# EAGLE design schematics-v5.1 (EAGLE 9.6.2)
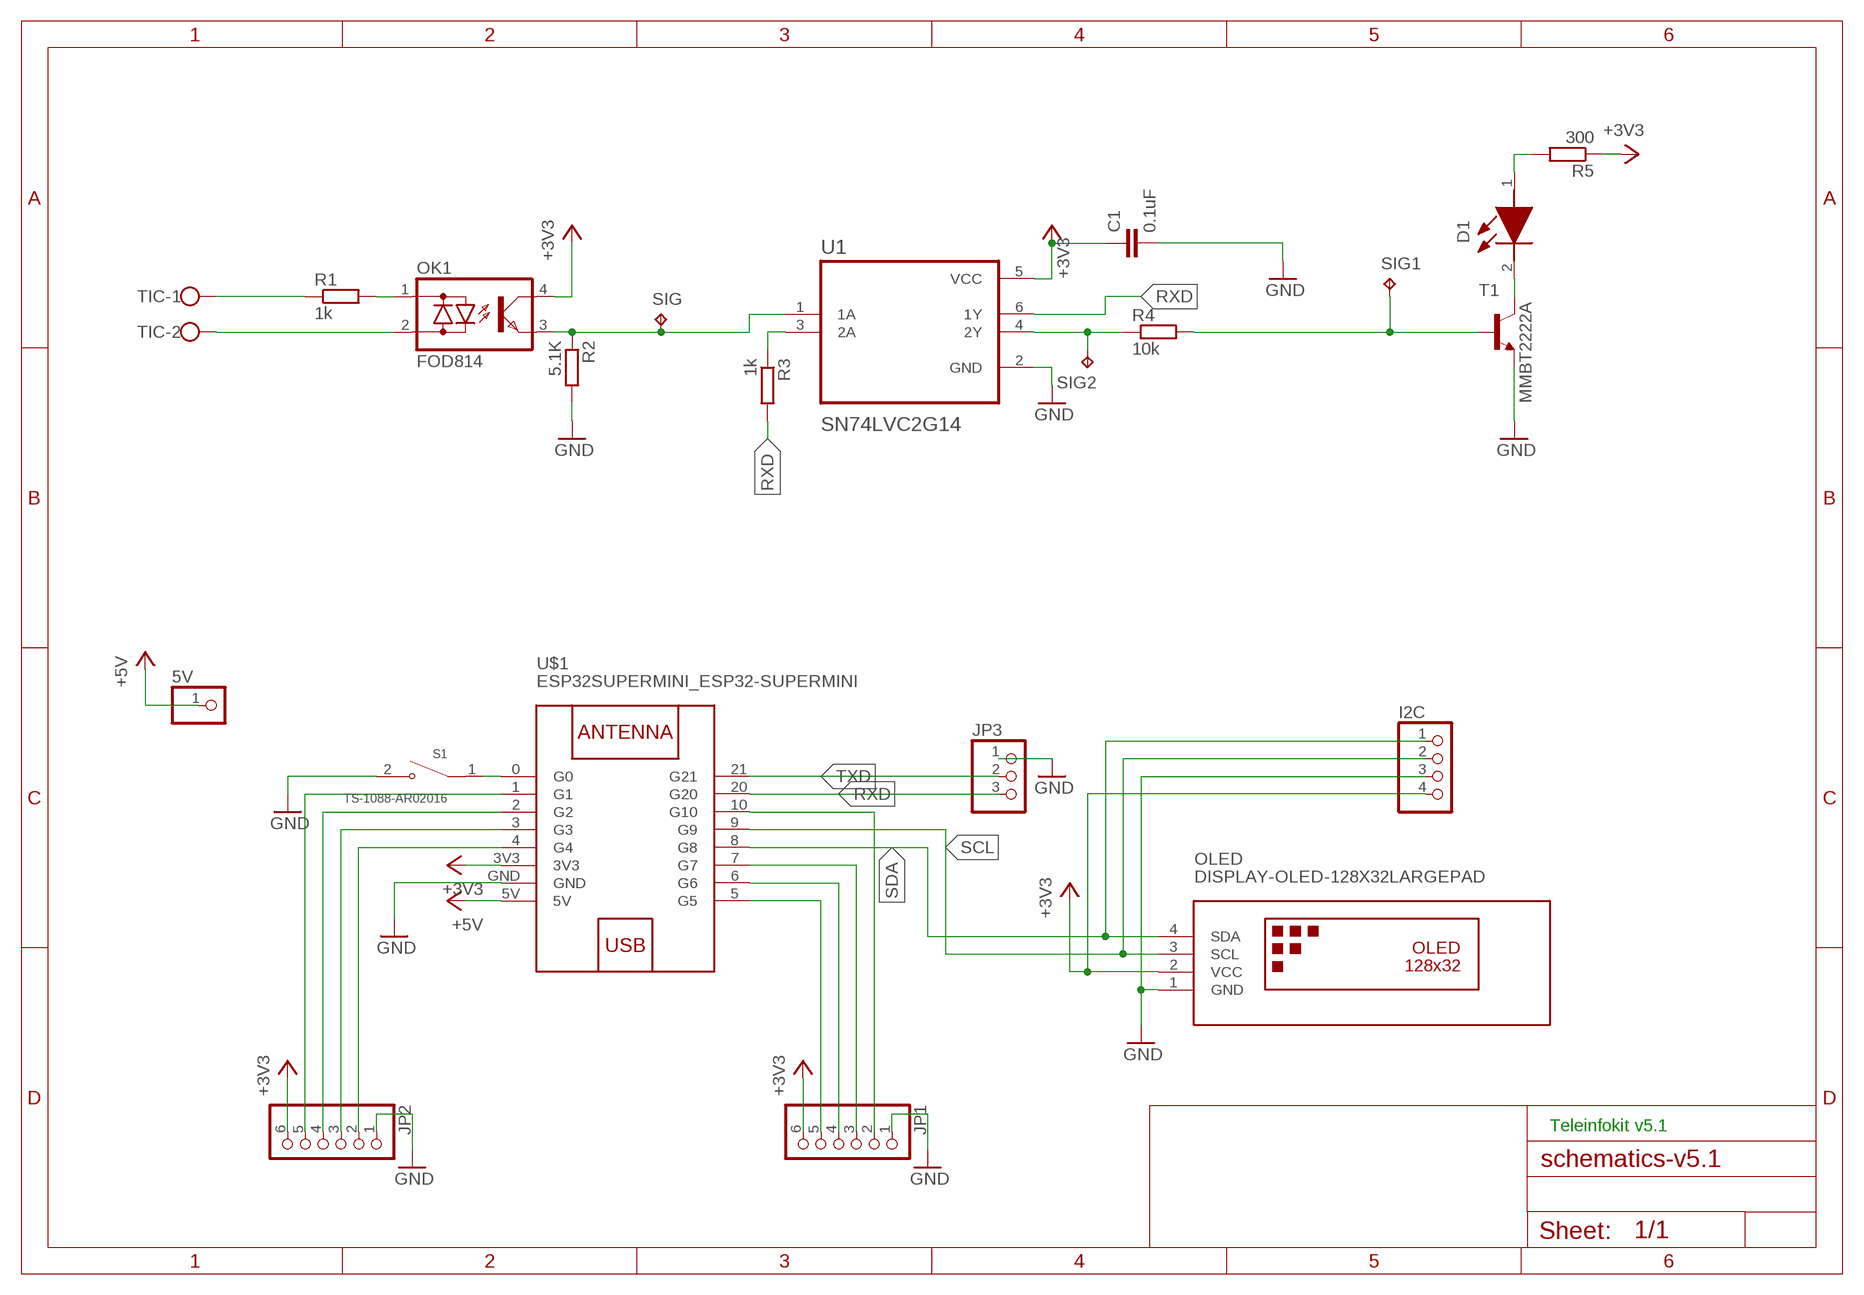
[diagram p0: schematic, sheet 1]

## Parts
5V  PINHD-1X1  [1X01]
C1  0.1uF  C-EUC0402K  [C0402K]
D1  17-21SURC_S530-A2_TR8  [1721SURCS530A2TR8]
I2C  PINHD-1X4ROUNDLARGE  [1X04ROUNDLARGE]
JP1  PINHD-1X6CB  [1X06-CLEANBIG]
JP2  PINHD-1X6CB  [1X06-CLEANBIG]
JP3  PINHD-1X3  [1X03]
OK1  FOD814  SFH6206  [DIL4-SMD]
OLED  DISPLAY-OLED-128X32LARGEPAD  [DISPLAY-OLED-128X32LARGE]
R1  1k  R-EU_R0805  [R0805]
R2  5.1K  R-EU_R0603  [R0603]
R3  1k  R-EU_R0805  [R0805]
R4  10k  R-EU_R0805  [R0805]
R5  300  R-EU_R0805  [R0805]
S1  TS-1088-AR02016  [SW_TS-1088-AR02016]
SIG  TPB1,27  [B1,27]
SIG1  TPB1,27  [B1,27]
SIG2  TPB1,27  [B1,27]
T1  MMBT2222A  MMBT2222ALT1-NPN-SOT23-BEC  [SOT23-BEC]
TIC  W237-102  [W237-102]
U1  SN74LVC2G14  SN74LVC2G14DBVR  [SOT95P280X145-6N]
U$1  ESP32SUPERMINI_ESP32-SUPERMINI  [ESP32SUPERMINI_ESP32-SUPERMINI]

## Nets
+3V3: C1.1 I2C.4 JP1.6 JP2.6 OK1.4(C) OLED.2(VCC) R5.1 U1.5(VCC) U$1.3V3
+5V: 5V.1 U$1.5V
GND: C1.2 I2C.3 JP1.1 JP2.1 JP3.1 OLED.1(GND) R2.2 S1.2 T1.E U1.2(GND) U$1.GND
IO1: JP2.5 U$1.1(G1)
IO2: JP2.4 U$1.2(G2)
IO3: JP2.3 U$1.3(G3)
IO4: JP2.2 U$1.4(G4)
IO5: JP1.5 U$1.5(G5)
IO6: JP1.4 U$1.6(G6)
IO7: JP1.3 U$1.7(G7)
IO10: JP1.2 U$1.10(G10)
N$1: OK1.1(AC1) R1.2
N$3: D1.1(A) R5.2
N$5: R4.1 SIG2.TP U1.4(2Y)
N$7: R1.1 TIC.1
N$8: OK1.2(AC2) TIC.2
N$11: OK1.3(E) R2.1 SIG.TP U1.1(1A)
N$12: D1.2(K) T1.C
N$13: R4.2 SIG1.TP T1.B
N$15: R3.1 U1.3(2A)
N$25: S1.1 U$1.0(G0)
RXD: JP3.3 R3.2 U1.6(1Y) U$1.20(G20)
SCL: I2C.2 OLED.3(SCL) U$1.9(G9)
SDA: I2C.1 OLED.4(SDA) U$1.8(G8)
TXD: JP3.2 U$1.21(G21)

## Notes on the sheet
- Teleinfokit v5.1

## Library data of the parts
5V = adafruit:PINHD-1X1: Pin header 1x1 for 0.1" spacing With round pins
C1 = rcl:C-EU: CAPACITOR, European symbol; LCSC_PART: C1525; SPICEPREFIX: C
D1 = 17-21SURC_S530-A2_TR8:17-21SURC_S530-A2_TR8: Standard LEDs - SMD 1.1mm Height Source: Datasheet <https://media.digikey.com/pdf/Data Sheets/Everlight PDFs/17-21SURC-S530-A2-TR8-V5~.pdf>; ARROW_PART_NUMBER: 17-21SURC/S530-A2/TR8; ARROW_PRICE-STOCK: https://www.arrow.com/en/products/17-21surcs530-a2tr8/everlight-electronics; DESCRIPTION: Standard LEDs - SMD 1.1mm Height; HEIGHT: mm; MANUFACTURER_NAME: Everlight; MANUFACTURER_PART_NUMBER: 17-21SURC/S530-A2/TR8; MOUSER_PART_NUMBER: N/A; MOUSER_PRICE-STOCK: https://www.mouser.co.uk/ProductDetail/Everlight/17-21SURC-S530-A2-TR8?qs=8cKuZ6Ok2lY9160apvjjyQ%3D%3D
I2C = pinhead-edit:PINHD-1X4: PIN HEADER
JP1 JP2 = adafruit:PINHD-1X6: PIN HEADER
JP3 = adafruit:PINHD-1X3: PIN HEADER
OK1 = optocoupler:SFH620: Optocoupler, Phototransistor Output, AC Input Source: http://www.vishay.com/docs/83675/sfh620.pdf; LCSC_PART: C479718; MF: VISHAY/TELEFUNKEN; MPN: SFH6206-3; OC_FARNELL: 1469585; OC_NEWARK: 58K2214
OLED = oled-edit:DISPLAY-OLED-128X32: 128x32 Dot Matrix OLED Module with I2C interface based on SSD1306 chip More details available here: http://www.tinyosshop.com/index.php?route=product/product&product_id=953 Schematic available here: http://www.tinyosshop.com/datasheet/OLED%2012832.pdf SSD1306 datasheet: https://cdn-shop.adafruit.com/datasheets/SSD1306.pdf Click here to find device on ebay.com <http://www.ebay.com/sch/oled+display+128x32+i2c>; LCSC_PART: C2718488
R1 = rcl:R-EU_: RESISTOR, European symbol; LCSC_PART: C17513; SPICEPREFIX: R
R2 = rcl:R-EU_: RESISTOR, European symbol; LCSC_PART: C23186; SPICEPREFIX: R
R3 R4 = rcl:R-EU_: RESISTOR, European symbol; LCSC_PART: C17414; SPICEPREFIX: R
R5 = rcl:R-EU_: RESISTOR, European symbol; LCSC_PART: C17617; SPICEPREFIX: R
S1 = TS-1088-AR02016:TS-1088-AR02016: Check availability <https://pricing.snapeda.com/parts/TS-1088-AR02016/Xunpu/view-part?ref=eda>; AVAILABILITY: Not in stock; CHECK_PRICES: https://www.snapeda.com/parts/TS-1088-AR02016/Xunpu/view-part/?ref=eda; DESCRIPTION: 50mA 4mm 100MΩ 100,000 Times 12V 160gf 3mm 2mm Round Button Vertical welding SPST SMD Tactile Switches ROHS; LCSC_PART: C720477; MF: Xunpu; MP: TS-1088-AR02016; PACKAGE: Package; PRICE: None; SNAPEDA_LINK: https://www.snapeda.com/parts/TS-1088-AR02016/Xunpu/view-part/?ref=snap
SIG SIG1 SIG2 = testpad:TP: Test pad
T1 = transistor:*-NPN-: NPN Transistror BF959 corrected 2008.03.06; LCSC_PART: C8512
TIC = conn-teleinfokit:W237-102: WAGO SCREW CLAMP; MPN: 237-102; OC_FARNELL: unknown; OC_NEWARK: 70K9898
U1 = SN74LVC2G14DBVR:SN74LVC2G14DBVR: Check availability <https://pricing.snapeda.com/parts/SN74LVC2G14DBVR/Texas%20Instruments/view-part?ref=eda>; AVAILABILITY: In Stock; DESCRIPTION: 2-ch, 1.65-V to 5.5-V inverters with Schmitt-Trigger inputs; LCSC_PART: C12401; MF: Texas Instruments; MP: SN74LVC2G14DBVR; PACKAGE: SOT-23-6 Texas Instruments; PRICE: None; PURCHASE-URL: https://pricing.snapeda.com/search/part/SN74LVC2G14DBVR/?ref=eda
U$1 = ESP32C3supermini:ESP32SUPERMINI_ESP32-SUPERMINI: WEMOS D1 mini: Mini Wi-Fi Board based on ESP-8266 device More details can be found here: https://www.wemos.cc/product/d1-mini.html Click here to find device on ebay.com <http://www.ebay.com/sch/wemos+d1+mini+nodemcu>

## Board
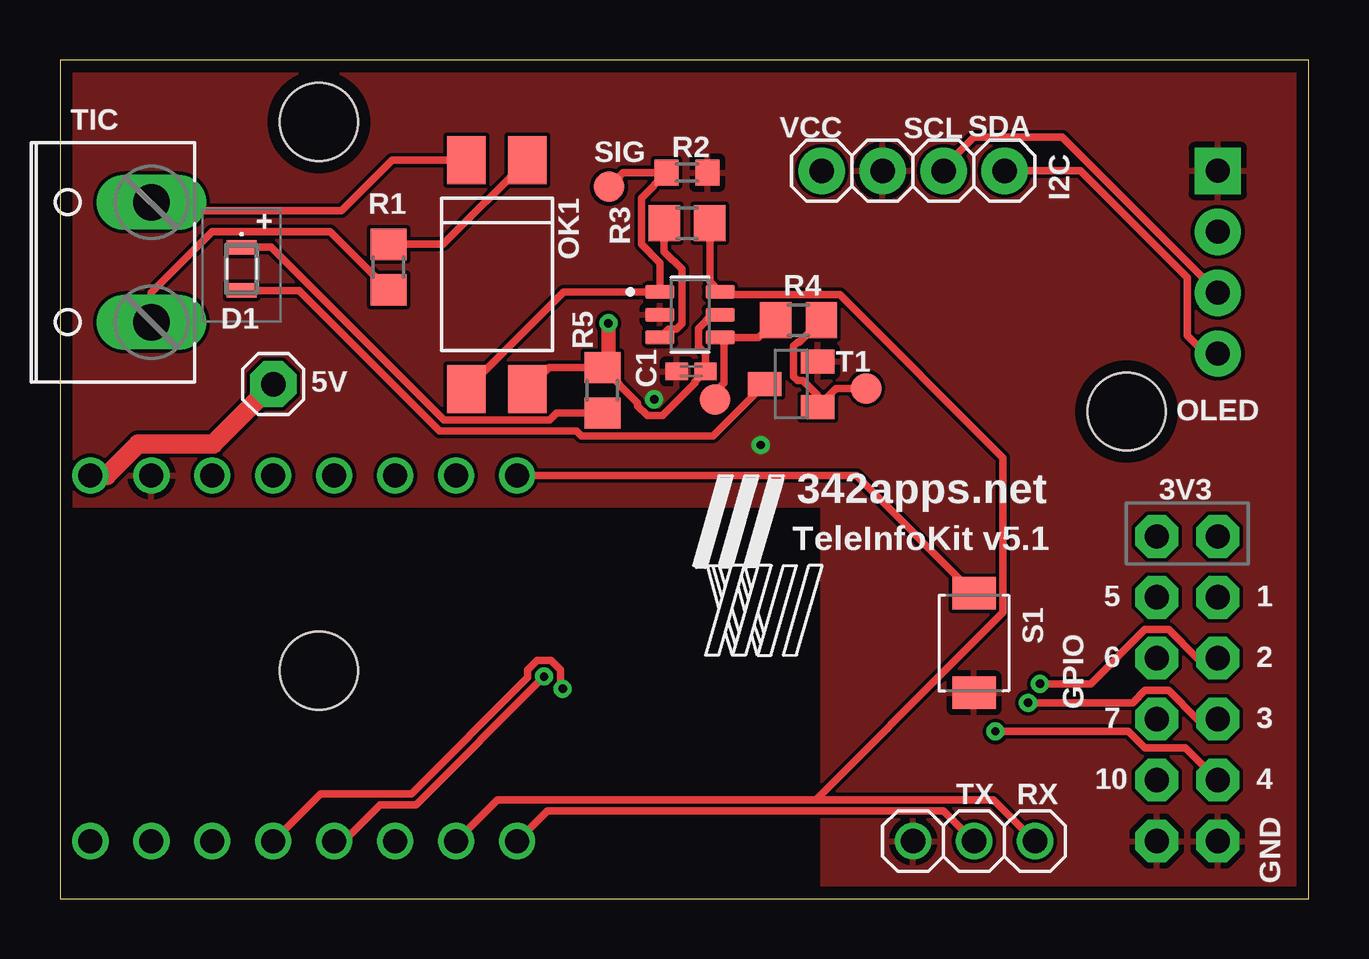
[diagram p1: board, top side]
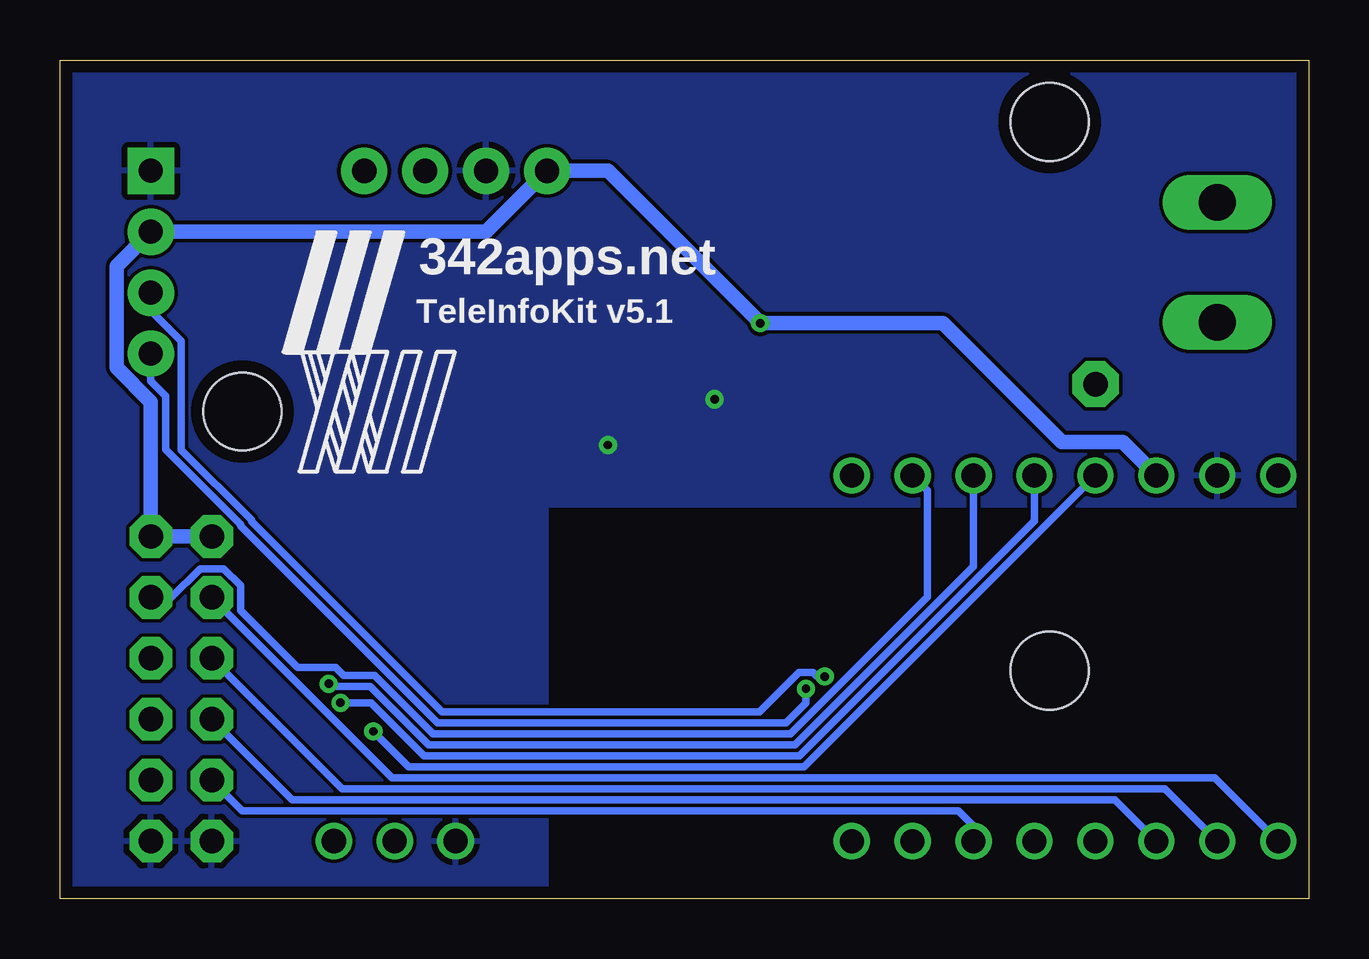
[diagram p2: board, bottom side, seen from below]

Size 52.05 x 34.98 mm. Coordinates in mm from the lower left corner, seen from the top.
Outline: 0,0 52.05,0 52.05,34.98 0,34.98 0,0
Copper layers (1*16): Top 0.035mm / dielectric 1.5mm / Bottom 0.035mm
Design rules "default *": minimum track width 6mil, minimum drill 0.35mm, track to track 6mil, track to pad 6mil, pad to pad 6mil, via to via 6mil, smd to smd 6mil, copper to edge 20mil, drill to drill 6mil, minimum pad ring 10mil, minimum via ring 8mil, stop-mask expansion 4mil, vias tented up to drill 0mil, thermal gap 10mil
Holes 3.25 mm at 44.45,20.32 10.79,9.53 10.79,32.38

### Footprints (pad centres in the part's own frame; a part is rotated, then mirrored left to right if it is on the bottom)
1X01 = drill 1.016 pad 1.93 octagon: 1 0,0
C0402K = smd 0.925 x 0.74: 1 -0.6,0; 2 0.6,0
1721SURCS530A2TR8 = smd 0.6 x 1.25: 1 0.9,0; 2 -0.9,0
1X04ROUNDLARGE = drill 1.016 pad 1.93: 1 -3.81,0; 2 -1.27,0; 3 1.27,0; 4 3.81,0
1X06-CLEANBIG = drill 1.016 pad 1.778 octagon: 1 -6.35,0; 2 -3.81,0; 3 -1.27,0; 4 1.27,0; 5 3.81,0; 6 6.35,0
1X03 = drill 1.016: 1 -2.54,0; 2 0,0; 3 2.54,0
DIL4-SMD = smd 1.6 x 2: 1 -1.27,-4.77; 2 1.27,-4.77; 3 1.27,4.77; 4 -1.27,4.77
DISPLAY-OLED-128X32LARGE = drill 1 pad 1.93 square: 1 -17.78,-3.81 | drill 1 pad 1.93: 2 -17.78,-1.27; 3 -17.78,1.27; 4 -17.78,3.81
R0805 = smd 1.3 x 1.5: 1 -0.95,0; 2 0.95,0
R0603 = smd 1 x 1.1: 1 -0.85,0; 2 0.85,0
SW_TS-1088-AR02016 = smd 1.35 x 1.8: 1 -2.075,0; 2 2.075,0
B1,27 = smd 1.27 x 1.27: TP 0,0
SOT23-BEC = smd 1 x 1.4: B -0.95,-1.1; C 0,1.1; E 0.95,-1.1
W237-102 = drill 1.524 pad 2.184 long: 1 -2.5,-1.27; 2 2.5,-1.27
SOT95P280X145-6N = smd 1.21 x 0.58: 1 -1.255,0.95; 2 -1.255,0; 3 -1.255,-0.95; 4 1.255,-0.95; 5 1.255,0; 6 1.255,0.95
ESP32SUPERMINI_ESP32-SUPERMINI = drill 1: 0 -11.43,9.525; 1 -11.43,6.985; 2 -11.43,4.445; 3 -11.43,1.905; 3V3 -11.43,-3.175; 4 -11.43,-0.635; 5 3.81,-8.255; 5V -11.43,-8.255; 6 3.81,-5.715; 7 3.81,-3.175; 8 3.81,-0.635; 9 3.81,1.905; 10 3.81,4.445; 20 3.81,6.985; 21 3.81,9.525; GND -11.43,-5.715

### Placement (x,y rotation side)
5V  8.89,21.46 0 top
C1  26.3,22 180 top
D1  7.57,26.26 90 top
I2C  35.56,30.35 180 top
JP1  45.72,8.76 90 top
JP2  48.26,8.76 90 top
JP3  38.1,2.41 0 top
OK1  18.21,26.04 180 top
OLED  30.48,26.54 180 top
R1  13.69,26.34 90 top
R2  26.14,30.28 0 top
R3  26.14,28.17 0 top
R4  30.78,24.13 0 top
R5  22.61,21.21 270 top
S1  38.1,10.67 270 top
SIG  22.89,29.69 0 top
SIG1  33.6,21.29 90 top
SIG2  27.3,20.83 0 top
T1  30.48,21.46 90 top
TIC  2.54,26.54 90 top
U1  26.26,24.36 0 top
U$1  9.53,6.22 270 top

### Tracks (layer width: path | path; a pad name or v marks a point on that pad's centre or on a via)
+3V3  (via drill 0.35)
  Top 0.305: OK1.4 20.38,22.16 R5.1 24.08,20.68 24.08,20.55 24.48,20.14 25.12,20.14 26.47,21.5 26.47,21.56 C1.1 26.91,22.74 26.61,23.04 26.61,23.78 27.18,24.36 U1.5
  Top 0.61: v22.86,24 22.86,22.41 R5.1
  Bottom 0.61: JP1.6 JP2.6 48.26,20.72 49.68,22.14 49.68,26.39 OLED.2 34.29,27.81 I2C.4 29.21,30.35 v22.86,24 15.24,24 10.29,19.05 7.75,19.05 U$1.3V3
+5V
  Top 0.813: 5V.1 6.39,18.97 3.27,18.97 1.95,17.65 U$1.5V
GND  (via drill 0.35)
  other vias: 29.21,18.92 24.77,20.83
  pour Top: 0,16.38 31.75,16.38 31.75,0 62.23,0 62.23,35.56 0,35.56
  pour Bottom: 0,35.56 0,16.38 31.75,16.38 31.75,0 62.23,0 62.23,35.56
IO1
  Bottom 0.305: U$1.1 15.89,17.04 15.89,12.59 21.6,6.88 36.5,6.88 38.93,9.32 40.23,9.32 40.56,9.65 42.15,9.65 44.53,12.03 44.53,13.07 45.23,13.77 46.21,13.77 47.41,12.57 JP2.5
IO2  (via drill 0.35)
  Top 0.305: v40.85,8.97 42.97,8.97 45.23,11.23 46.21,11.23 47.41,10.03 JP2.4
  Bottom 0.305: U$1.2 13.97,13.87 21.41,6.43 36.69,6.43 39.12,8.86 40.74,8.86 v40.85,8.97
IO3  (via drill 0.35)
  Top 0.305: JP2.3 47.41,7.49 46.21,8.69 45.23,8.69 44.72,8.18 v40.36,8.18
  Bottom 0.305: U$1.3 11.43,15.76 21.22,5.97 36.88,5.97 39.09,8.18 v40.36,8.18
IO4  (via drill 0.35)
  Top 0.305: v38.99,6.99 44.54,6.99 45.23,6.3 46.91,6.3 JP2.2
  Bottom 0.305: U$1.4 21.03,5.51 37.52,5.51 v38.99,6.99
IO5
  Bottom 0.305: JP1.5 38.2,5.05 3.91,5.05 U$1.5
IO6
  Bottom 0.305: JP1.4 40.28,4.6 5.99,4.6 U$1.6
IO7
  Bottom 0.305: JP1.3 42.37,4.14 8.08,4.14 U$1.7
IO10
  Bottom 0.305: JP1.2 44.45,3.68 14.61,3.68 13.97,3.05 U$1.10
N$1
  Top 0.305: R1.2 15.97,27.29 OK1.1
N$3
  Top 0.305: R5.2 20.71,20.26 20.41,19.96 16.02,19.96 8.81,27.16 D1.1
N$5
  Top 0.305: R4.1 29.11,23.41 27.94,23.41 | 27.94,23.41 U1.4 | SIG2.TP 27.3,21.13 27.67,21.5 27.67,23.14 27.94,23.41
N$7
  Top 0.305: R1.1 11.27,27.81 6.35,27.81 3.81,25.27 TIC.1
N$8
  Top 0.305: OK1.2 13.85,30.8 11.74,28.7 4.15,28.7 TIC.2
N$11
  Top 0.305: OK1.3 20.98,25.31 U1.1 25.01,26.52 24.23,27.29 24.23,29.22 R2.1 23.47,30.28 SIG.TP
N$12
  Top 0.305: T1.C 27.22,19.3 21.73,19.3 21.53,19.5 15.83,19.5 9.97,25.36 D1.2
N$13
  Top 0.305: R4.2 30.82,23.22 30.75,23.22 30.57,23.04 30.57,21.79 30.75,21.61 30.97,21.61 31.58,21 T1.B 32.35,21.29 SIG1.TP
N$15
  Top 0.305: R3.1 25.19,26.98 25.92,26.25 25.92,23.98 25.7,23.76 25.36,23.76 U1.3
N$25
  Top 0.305: U$1.0 33.19,17.65 S1.1
RXD
  Top 0.305: R3.2 27.09,25.74 U1.6 27.64,25.18 32.51,25.18 39.3,18.39 39.3,11.94 34.64,7.27 34.54,7.18 31.5,4.14 | U$1.20 18.24,4.14 30.48,4.14 31.5,4.14 | JP3.3 38.91,4.14 31.5,4.14
SCL  (via drill 0.35)
  Top 0.305: v20.18,9.27 14.84,3.93 13.34,3.93 11.83,2.41 U$1.9 | OLED.3 41.78,31.75 38.1,31.75 36.83,30.48 I2C.2
  Bottom 0.305: v20.18,9.27 20.5,9.27 20.67,9.45 21.24,9.45 22.89,7.8 36.12,7.8 44.07,15.74 44.07,15.8 46.99,18.72 46.99,23.26 48.26,24.53 OLED.3
SDA  (via drill 0.35)
  Top 0.305: U$1.8 10.86,4.39 14.65,4.39 19.5,9.23 19.5,9.55 19.89,9.95 20.46,9.95 20.86,9.55 20.86,8.86 v20.95,8.76 | I2C.1 42.53,30.35 46.99,25.9 46.99,23.48 47.73,22.73 OLED.4
  Bottom 0.305: v20.95,8.76 20.95,8.17 21.79,7.34 36.31,7.34 44.53,15.55 44.53,15.61 47.65,18.73 47.65,20.97 48.26,21.58 OLED.4
TXD
  Top 0.305: U$1.21 20.32,3.68 36.83,3.68 JP3.2

### Text on the board
tNames: VCC | SCL | SDA | + | 342apps.net | 3V3 | TeleInfoKit v5.1 | 5 | 1 | GPIO | 6 | 2 | 7 | 3 | 10 | 4 | TX | RX | GND
bNames: 342apps.net | TeleInfoKit v5.1